# Altium project GTV4.0_Board.PrjPcb (part 6 of 11)

## Sheet Controller_Section.SchDoc
size 420 x 297 mm; DocumentNumber: 7; SheetNumber: 7; SheetTotal: 17
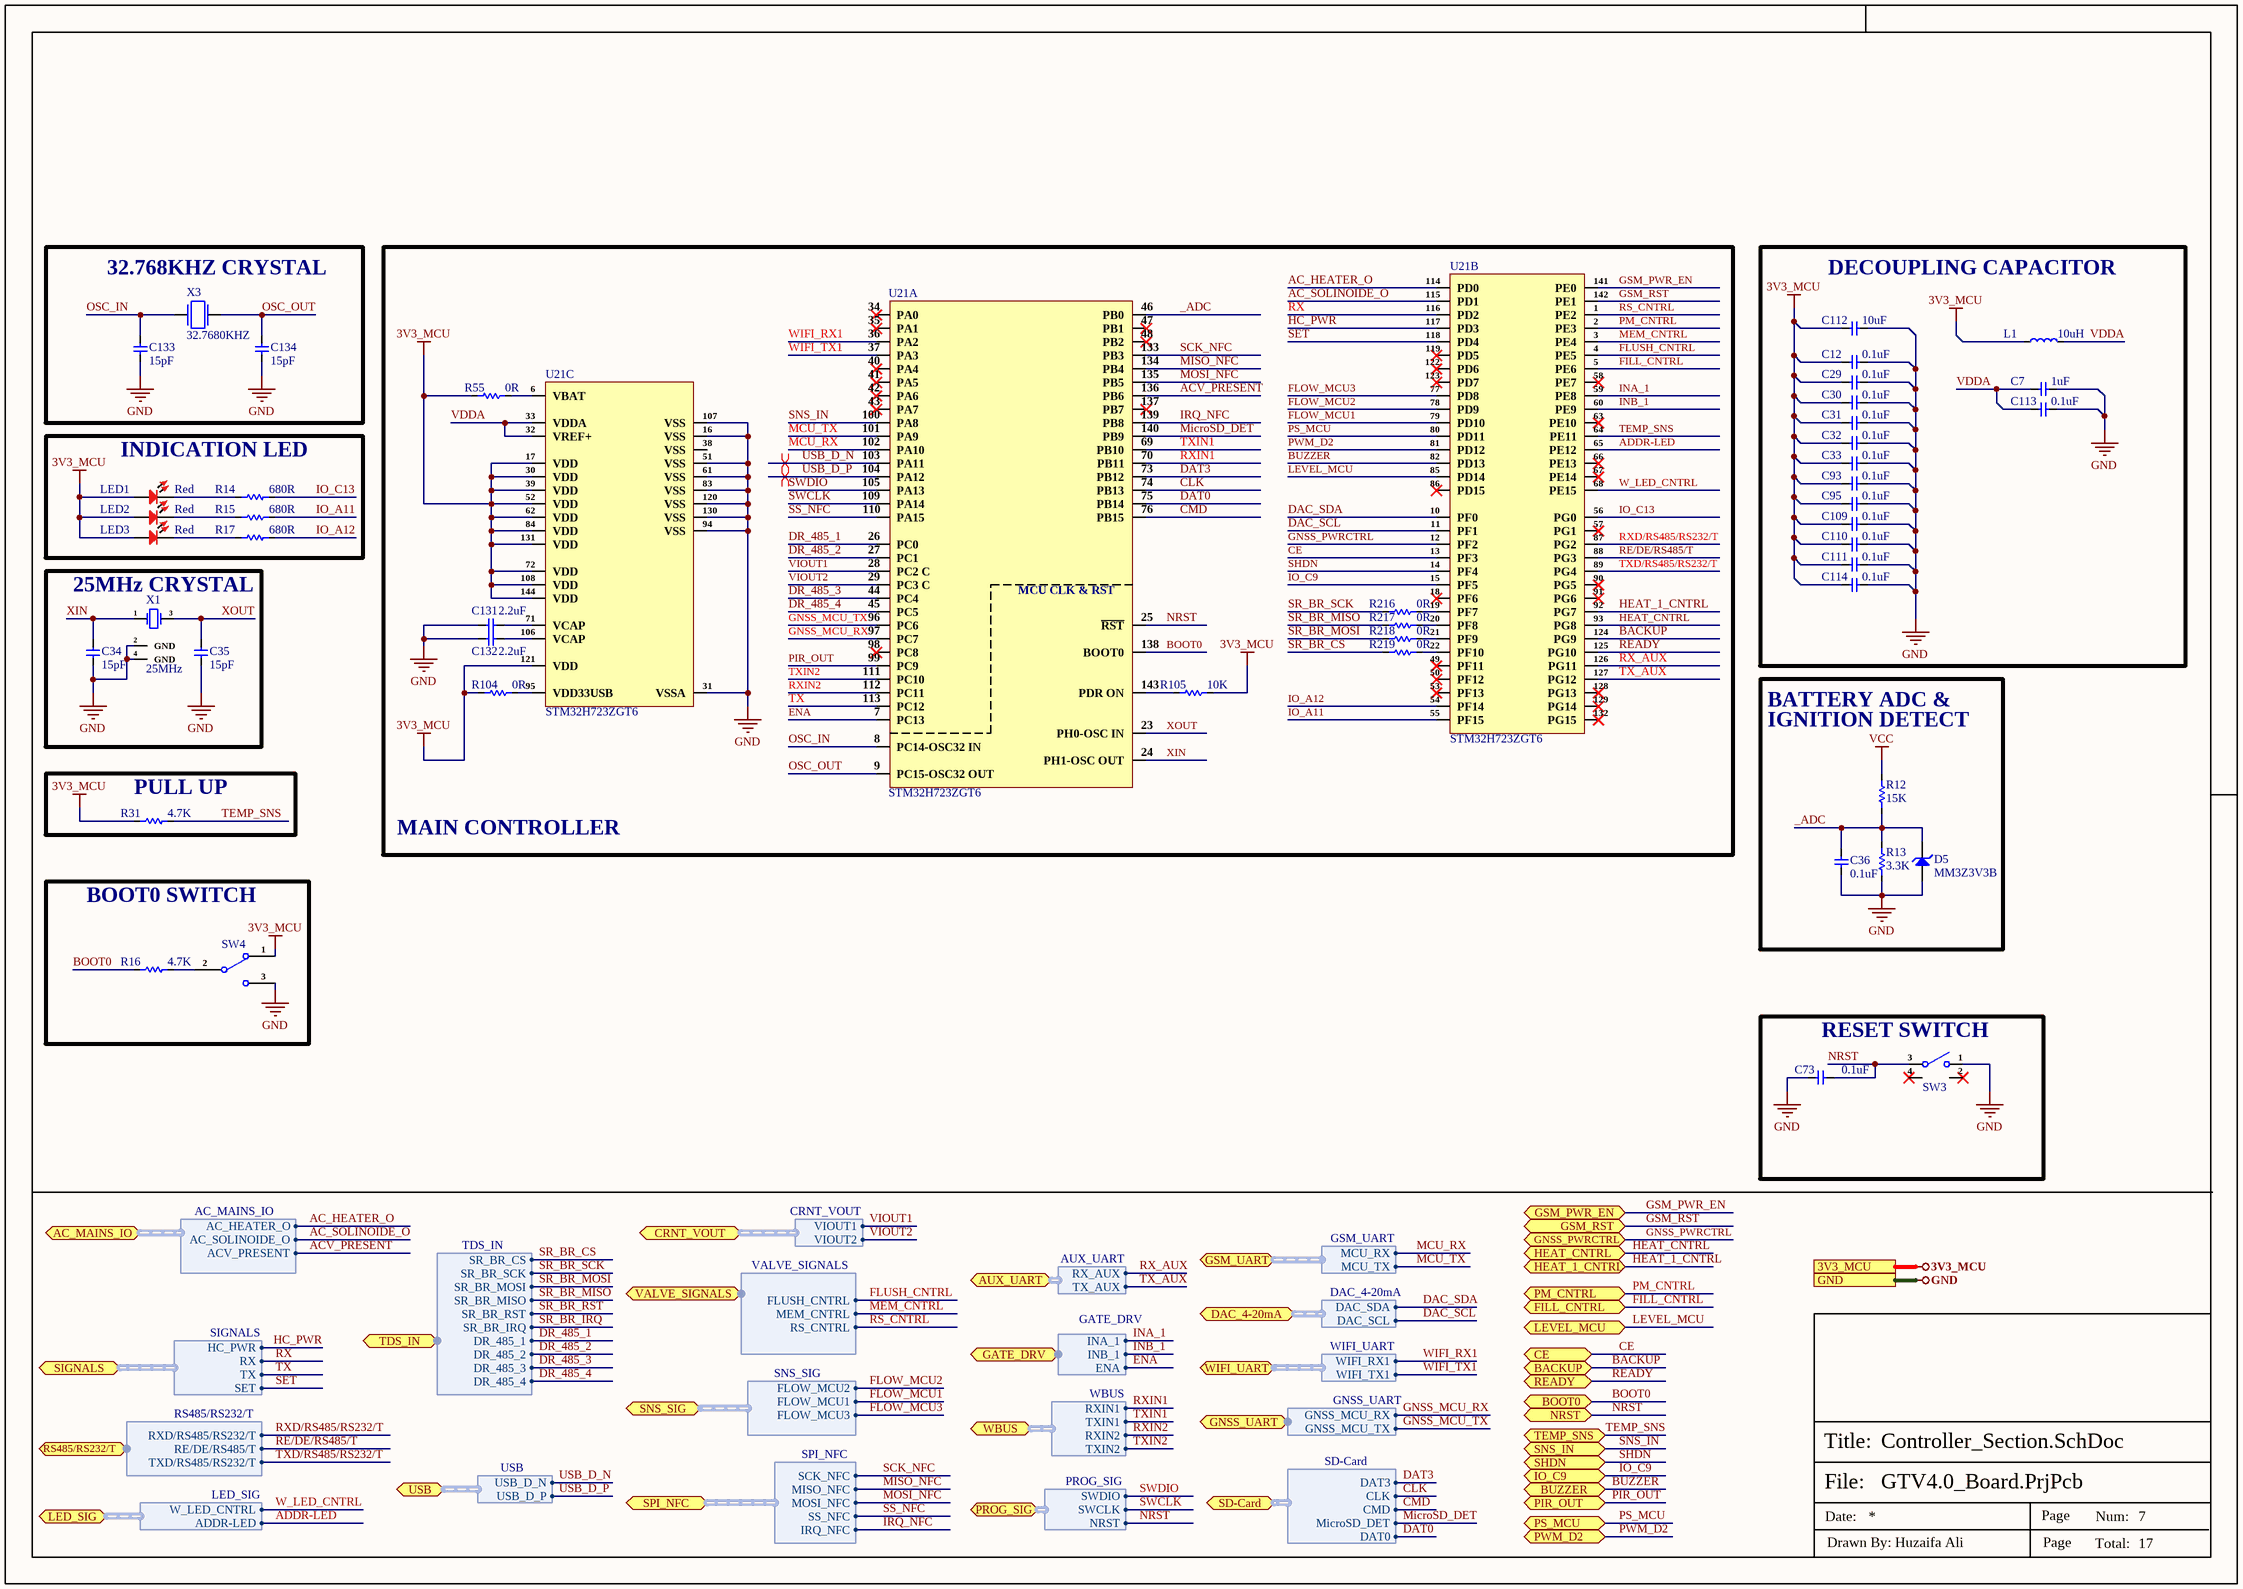
[diagram p9: Controller_Section.SchDoc]

### Parts
C7  1uF  [Cap-0402]
C12  0.1uF  [Cap-0402]
C29  0.1uF  [Cap-0402]
C30  0.1uF  [Cap-0402]
C31  0.1uF  [Cap-0402]
C32  0.1uF  [Cap-0402]
C33  0.1uF  [Cap-0402]
C34  15pF  [Cap-0201]
C35  15pF  [Cap-0201]
C36  0.1uF  [Cap-0402]
C73  0.1uF  [Cap-0402]
C93  0.1uF  [Cap-0402]
C95  0.1uF  [Cap-0402]
C109  0.1uF  [Cap-0402]
C110  0.1uF  [Cap-0402]
C111  0.1uF  [Cap-0402]
C112  10uF  [Cap-0402]
C113  0.1uF  [Cap-0402]
C114  0.1uF  [Cap-0402]
C131  2.2uF  [Cap-0402]
C132  2.2uF  [Cap-0402]
C133  15pF  [Cap-0201]
C134  15pF  [Cap-0201]
D5  MM3Z3V3B  [SOD323F]
L1  10uH  [Ind-0805]
LED1  Red  [LED-0402]
LED2  Red  [LED-0402]
LED3  Red  [LED-0402]
R12  15K  [Res-0603]
R13  3.3K  [Res-0603]
R14  680R  [Res-0603]
R15  680R  [Res-0603]
R16  4.7K  [Res-0402]
R17  680R  [Res-0603]
R31  4.7K  [Res-0402]
R55  0R  [Res-0402]
R104  0R  [Res-0402]
R105  10K  [Res-0402]
R216  0R  [Res-0402]
R217  0R  [Res-0402]
R218  0R  [Res-0402]
R219  0R  [Res-0402]
SW3  FSM6JSMATR  [FSM6JSMATR]  (value not drawn)
SW4  (no value)  [SS-12D02-G040]
U21  STM32H723ZGT6  [LQFP-144(20x20)]  (parts A,B,C of 3)
X1  25MHz  [Q22FA12800090]
X3  32.7680KHZ  [NX3215SA-32.768K-STD-MUA-8_]

### Blocks framed on the sheet
32.768KHZ CRYSTAL: C133 C134 X3
MAIN CONTROLLER: C131 C132 R55 R104 R105 R216-R219 U21
DECOUPLING CAPACITOR: C7 C12 C29-C33 C93 C95 C109-C114 L1
INDICATION LED: LED1-LED3 R14 R15 R17
25MHz CRYSTAL: C34 C35 X1
PULL UP: R31
BOOT0 SWITCH: R16 SW4
RESET SWITCH: C73 SW3

### Ports
3V3_MCU, AC_MAINS_IO (bidir, harness AC_MAINS_IO), AUX_UART (bidir, harness AUX_UART), BACKUP (bidir), BOOT0 (bidir), BUZZER (bidir), CE (bidir), CRNT_VOUT (bidir, harness CRNT_VOUT), DAC_4-20mA (bidir, harness DAC_4-20mA), FILL_CNTRL (bidir), GATE_DRV (bidir, harness GATE_DRV), GND, GNSS_PWRCTRL (bidir), GNSS_UART (bidir, harness GNSS_UART), GSM_PWR_EN (bidir), GSM_RST (bidir), GSM_UART (bidir, harness GSM_UART), HEAT_1_CNTRL (bidir), HEAT_CNTRL (bidir), IO_C9 (bidir), LED_SIG (bidir, harness LED_SIG), LEVEL_MCU (bidir), NRST (bidir), PIR_OUT (bidir), PM_CNTRL (bidir), PROG_SIG (bidir, harness PROG_SIG), PS_MCU (bidir), PWM_D2 (bidir), READY (bidir), RS485/RS232/T (bidir, harness RS485/RS232/T), SD-Card (bidir, harness SD-Card), SHDN (bidir), SIGNALS (bidir, harness SIGNALS), SNS_IN (bidir), SNS_SIG (bidir, harness SNS_SIG), SPI_NFC (bidir, harness SPI_NFC), TDS_IN (bidir, harness TDS_IN), TEMP_SNS (bidir), USB (bidir, harness USB), VALVE_SIGNALS (bidir, harness VALVE_SIGNALS), WBUS (bidir, harness WBUS), WIFI_UART (bidir, harness WIFI_UART)

### Harnesses
SNS_SIG: FLOW_MCU1, FLOW_MCU2, FLOW_MCU3
SPI_NFC: MISO_NFC, MOSI_NFC, SS_NFC, IRQ_NFC, SCK_NFC
TDS_IN: SR_BR_RST, SR_BR_IRQ, DR_485_1, DR_485_2, SR_BR_CS, SR_BR_SCK, SR_BR_MOSI, SR_BR_MISO, DR_485_3, DR_485_4
PROG_SIG: SWDIO, SWCLK, NRST
WBUS: RXIN1, TXIN1, RXIN2, TXIN2
GATE_DRV: INA_1, INB_1, ENA
SD-Card: DAT3, CLK, CMD, DAT0, MicroSD_DET
LED_SIG: ADDR-LED, W_LED_CNTRL
RS485/RS232/T: RXD/RS485/RS232/T, RE/DE/RS485/T, TXD/RS485/RS232/T
SIGNALS: RX, TX, SET, HC_PWR
VALVE_SIGNALS: FLUSH_CNTRL, MEM_CNTRL, RS_CNTRL
AUX_UART: RX_AUX, TX_AUX
GNSS_UART: GNSS_MCU_RX, GNSS_MCU_TX
WIFI_UART: WIFI_RX1, WIFI_TX1
DAC_4-20mA: DAC_SDA, DAC_SCL
GSM_UART: MCU_RX, MCU_TX
CRNT_VOUT: VIOUT1, VIOUT2
AC_MAINS_IO: AC_HEATER_O, AC_SOLINOIDE_O, ACV_PRESENT
USB: USB_D_N, USB_D_P

### Nets
3V3_MCU: C12.1 C29.1 C30.1 C31.1 C32.1 C33.1 C93.1 C95.1 C109.1 C110.1 C111.1 C112.1 C114.1 L1.1 LED1.1 LED2.1 LED3.1 R31.1 R55.1 R104.1 R105.2 SW4.1 U21.17(VDD) U21.30(VDD) U21.39(VDD) U21.52(VDD) U21.62(VDD) U21.72(VDD) U21.84(VDD) U21.108(VDD) U21.121(VDD) U21.131(VDD) U21.144(VDD) ; port 3V3_MCU
GND: C7.2 C12.2 C29.2 C30.2 C31.2 C32.2 C33.2 C34.1 C35.1 C36.1 C73.1 C93.2 C95.2 C109.2 C110.2 C111.2 C112.2 C113.2 C114.2 C131.1 C132.1 C133.1 C134.1 D5.1(A) R13.1 SW3.1 SW4.3 U21.16(VSS) U21.31(VSSA) U21.51(VSS) U21.61(VSS) U21.83(VSS) U21.94(VSS) U21.107(VSS) U21.120(VSS) U21.130(VSS) X1.2(GND) X1.4(GND) ; port GND
VCC: R12.2
_ADC: C36.2 D5.2(K) R12.1 R13.2 U21.46(PB0)
AC_HEATER_O: U21.114(PD0) ; port AC_MAINS_IO.AC_HEATER_O
AC_SOLINOIDE_O: U21.115(PD1) ; port AC_MAINS_IO.AC_SOLINOIDE_O
ACV_PRESENT: U21.136(PB6) ; port AC_MAINS_IO.ACV_PRESENT
ADDR-LED: U21.65(PE12) ; port LED_SIG.ADDR-LED
BACKUP: U21.124(PG9) ; port BACKUP
BOOT0: R16.1 U21.138(BOOT0) ; port BOOT0
BUZZER: U21.82(PD13) ; port BUZZER
CE: U21.13(PF3) ; port CE
CLK: U21.74(PB13) ; port SD-Card.CLK
CMD: U21.76(PB15) ; port SD-Card.CMD
DAC_SCL: U21.11(PF1) ; port DAC_4-20mA.DAC_SCL
DAC_SDA: U21.10(PF0) ; port DAC_4-20mA.DAC_SDA
DAT0: U21.75(PB14) ; port SD-Card.DAT0
DAT3: U21.73(PB12) ; port SD-Card.DAT3
DR_485_1: U21.26(PC0) ; port TDS_IN.DR_485_1
DR_485_2: U21.27(PC1) ; port TDS_IN.DR_485_2
DR_485_3: U21.44(PC4) ; port TDS_IN.DR_485_3
DR_485_4: U21.45(PC5) ; port TDS_IN.DR_485_4
ENA: U21.7(PC13) ; port GATE_DRV.ENA
FILL_CNTRL: U21.5(PE6) ; port FILL_CNTRL
FLOW_MCU1: U21.79(PD10) ; port SNS_SIG.FLOW_MCU1
FLOW_MCU2: U21.78(PD9) ; port SNS_SIG.FLOW_MCU2
FLOW_MCU3: U21.77(PD8) ; port SNS_SIG.FLOW_MCU3
FLUSH_CNTRL: U21.4(PE5) ; port VALVE_SIGNALS.FLUSH_CNTRL
GNSS_MCU_RX: U21.97(PC7) ; port GNSS_UART.GNSS_MCU_RX
GNSS_MCU_TX: U21.96(PC6) ; port GNSS_UART.GNSS_MCU_TX
GNSS_PWRCTRL: U21.12(PF2) ; port GNSS_PWRCTRL
GSM_PWR_EN: U21.141(PE0) ; port GSM_PWR_EN
GSM_RST: U21.142(PE1) ; port GSM_RST
HC_PWR: U21.117(PD3) ; port SIGNALS.HC_PWR
HEAT_1_CNTRL: U21.92(PG7) ; port HEAT_1_CNTRL
HEAT_CNTRL: U21.93(PG8) ; port HEAT_CNTRL
INA_1: U21.59(PE8) ; port GATE_DRV.INA_1
INB_1: U21.60(PE9) ; port GATE_DRV.INB_1
IO_A11: R15.2 U21.55(PF15)
IO_A12: R17.2 U21.54(PF14)
IO_C9: U21.15(PF5) ; port IO_C9
IO_C13: R14.2 U21.56(PG0)
IRQ_NFC: U21.139(PB8) ; port SPI_NFC.IRQ_NFC
LEVEL_MCU: U21.85(PD14) ; port LEVEL_MCU
MCU_RX: U21.102(PA10) ; port GSM_UART.MCU_RX
MCU_TX: U21.101(PA9) ; port GSM_UART.MCU_TX
MEM_CNTRL: U21.3(PE4) ; port VALVE_SIGNALS.MEM_CNTRL
MicroSD_DET: U21.140(PB9) ; port SD-Card.MicroSD_DET
MISO_NFC: U21.134(PB4) ; port SPI_NFC.MISO_NFC
MOSI_NFC: U21.135(PB5) ; port SPI_NFC.MOSI_NFC
NRST: C73.2 SW3.3 U21.25(~{RST}) ; port NRST, port PROG_SIG.NRST
OSC_IN: C133.2 U21.8(PC14-OSC32_IN) X3.2
OSC_OUT: C134.2 U21.9(PC15-OSC32_OUT) X3.1
PIR_OUT: U21.99(PC9) ; port PIR_OUT
PM_CNTRL: U21.2(PE3) ; port PM_CNTRL
PS_MCU: U21.80(PD11) ; port PS_MCU
PWM_D2: U21.81(PD12) ; port PWM_D2
RE/DE/RS485/T: U21.88(PG3) ; port RS485/RS232/T.RE/DE/RS485/T
READY: U21.125(PG10) ; port READY
RS_CNTRL: U21.1(PE2) ; port VALVE_SIGNALS.RS_CNTRL
RX: U21.116(PD2) ; port SIGNALS.RX
RX_AUX: U21.126(PG11) ; port AUX_UART.RX_AUX
RXD/RS485/RS232/T: U21.87(PG2) ; port RS485/RS232/T.RXD/RS485/RS232/T
RXIN1: U21.70(PB11) ; port WBUS.RXIN1
RXIN2: U21.112(PC11) ; port WBUS.RXIN2
SCK_NFC: U21.133(PB3) ; port SPI_NFC.SCK_NFC
SET: U21.118(PD4) ; port SIGNALS.SET
SHDN: U21.14(PF4) ; port SHDN
SNS_IN: U21.100(PA8) ; port SNS_IN
SR_BR_CS: R219.1 ; port TDS_IN.SR_BR_CS
SR_BR_MISO: R217.1 ; port TDS_IN.SR_BR_MISO
SR_BR_MOSI: R218.1 ; port TDS_IN.SR_BR_MOSI
SR_BR_SCK: R216.1 ; port TDS_IN.SR_BR_SCK
SS_NFC: U21.110(PA15) ; port SPI_NFC.SS_NFC
SWCLK: U21.109(PA14) ; port PROG_SIG.SWCLK
SWDIO: U21.105(PA13) ; port PROG_SIG.SWDIO
TEMP_SNS: R31.2 U21.64(PE11) ; port TEMP_SNS
TX: U21.113(PC12) ; port SIGNALS.TX
TX_AUX: U21.127(PG12) ; port AUX_UART.TX_AUX
TXD/RS485/RS232/T: U21.89(PG4) ; port RS485/RS232/T.TXD/RS485/RS232/T
TXIN1: U21.69(PB10) ; port WBUS.TXIN1
TXIN2: U21.111(PC10) ; port WBUS.TXIN2
USB_D_N: U21.103(PA11) ; port USB.USB_D_N
USB_D_P: U21.104(PA12) ; port USB.USB_D_P
VDDA: C7.1 C113.1 L1.2 U21.32(VREF+) U21.33(VDDA)
VIOUT1: U21.28(PC2_C) ; port CRNT_VOUT.VIOUT1  [project net CRNT_VOUT.VIOUT1]
VIOUT2: U21.29(PC3_C) ; port CRNT_VOUT.VIOUT2  [project net CRNT_VOUT.VIOUT2]
W_LED_CNTRL: U21.68(PE15) ; port LED_SIG.W_LED_CNTRL
WIFI_RX1: U21.36(PA2) ; port WIFI_UART.WIFI_RX1
WIFI_TX1: U21.37(PA3) ; port WIFI_UART.WIFI_TX1
XIN: C34.2 U21.24(PH1-OSC_OUT) X1.1(OSC1)
XOUT: C35.2 U21.23(PH0-OSC_IN) X1.3(OSC2)
NetC131_2: C131.2 U21.71(VCAP)
NetC132_2: C132.2 U21.106(VCAP)
NetLED1_2: LED1.2 R14.1
NetLED2_2: LED2.2 R15.1
NetLED3_2: LED3.2 R17.1
NetR16_2: R16.2 SW4.2
NetR55_2: R55.2 U21.6(VBAT)
NetR104_2: R104.2 U21.95(VDD33USB)
NetR105_1: R105.1 U21.143(PDR_ON)
NetR216_2: R216.2 U21.19(PF7)
NetR217_2: R217.2 U21.20(PF8)
NetR218_2: R218.2 U21.21(PF9)
NetR219_2: R219.2 U21.22(PF10)

Not connected (* = marked no-connect by the designer): SW3 2* 4*; U21 18(PF6)* 34(PA0)* 35(PA1)* 38(VSS) 40(PA4)* 41(PA5)* 42(PA6)* 43(PA7)* 47(PB1)* 48(PB2)* 49(PF11)* 50(PF12)* 53(PF13)* 57(PG1)* 58(PE7)* 63(PE10)* 66(PE13)* 67(PE14)* 86(PD15)* 90(PG5)* 91(PG6)* 98(PC8)* 119(PD5)* 122(PD6)* 123(PD7)* 128(PG13)* 129(PG14)* 132(PG15)* 137(PB7)*

### Layout directives
differential pair; differential pair class USB_D_Lines; net class USB_D; rule Matched Net Lengths [Tolerance = 50mil]; rule Impedance Constraint [Min = 85.00    Max = 90.00    ]: USB_D_N, USB_D_P

### Notes on the sheet
- BATTERY ADC &
- (near R12) IGNITION DETECT
- File:
- Title:
- Date:
- Page
- Num:
- Total:
- Drawn By: Huzaifa Ali
- (in symbol STM32H723ZGT6, part A) MCU CLK & RST

### Library data of the parts
C7 = CC0402KRX5R7BB105: CAP CER 1UF 16V X5R 0402; Manufacturer: Yageo; Tolerance: 10%; Item Type: Capacitor; Supplier 1: Digi-Key; Manufacturer Part Number: CC0402KRX5R7BB105; Stock 1: 1405667; Pricing 1: 1=0.36, 10=0.252, 100=0.1512, 500=0.1134, 1000=0.09576, 2500=0.09072, 5000=0.08568 (USD); Mount: Surface Mount; Case/Package: 0402; Case Code (Metric): 1005; Case Code (Imperial): 0402; Weight: 2.3E-05oz; Min Operating Temperature: -55°C; Max Operating Temperature: 85°C; Capacitance: 1uF; Packaging: Tape and Reel; Voltage Rating: 16V; Dielectric: X5R; Termination: SMD/SMT; Voltage Rating (DC): 16V; Length: 1mm; Width: 0.02inch; Height: 0.5mm; Thickness: 0.022inch; ComponentLink1URL: http://www.yageo.com/documents/recent/UPY-GPHC_X5R_4V-to-50V_12.pdf?src-supplier=Avnet+Europe; ComponentLink1Description: http://www.yageo.com/documents/recent/UPY-GPHC_X5R_4V-to-50V_12.pdf?src-supplier=Avnet+Europe; Supplier Part Number 1: 311-1691-6-ND; Composition: Ceramic; Depth: 0.5mm; Radiation Hardening: No; Lead Free: Lead Free; Halogen Free: Halogen Free; LCSC Part Number: C325464
C12 C29-C33 C36 C73 C93 C95 C109-C111 C113 C114 = C1005X5R1H104K050BB: CAP CER 0.1UF 50V X5R 0402; Manufacturer: TDK; Capacitance: 100nF; Tolerance: 10%; Dielectric Material: Ceramic; Item Type: Capacitor; Supplier 1: Digi-Key; Manufacturer Part Number: C1005X5R1H104K050BB; Stock 1: 1455182; Pricing 1: 1=0.12, 10=0.09, 50=0.049, 100=0.04, 500=0.02858, 1000=0.02245, 2500=0.02041, 5000=0.01878 (USD); Mount: Surface Mount; Case/Package: 0402; Case Code (Metric): 1005; Case Code (Imperial): 0402; Weight: 2.3E-05oz; Min Operating Temperature: -55°C; Max Operating Temperature: 85°C; Packaging: Tape and Reel; Voltage Rating: 50V; Dielectric: X5R; Termination: SMD/SMT; Voltage Rating (DC): 50V; Package Quantity: 1; Length: 1mm; Width: 0.02inch; Height: 0.5mm; Thickness: 0.022inch; RoHS Compliant: Yes; ComponentLink1URL: https://product.tdk.com/info/en/catalog/spec/mlccspec_commercial_general_midvoltage_en.pdf?src-supplier=Digi-Key; ComponentLink1Description: https://product.tdk.com/info/en/catalog/spec/mlccspec_commercial_general_midvoltage_en.pdf?src-supplier=Digi-Key; ComponentLink2URL: http://www.tdk.co.jp/tefe02/e413_c.pdf?src-supplier=Future+Electronics; ComponentLink2Description: http://www.tdk.co.jp/tefe02/e413_c.pdf?src-supplier=Future+Electronics; ComponentLink3URL: https://www.verical.com/server-webapp/html/getDatasheet?partID=743571&src-supplier=Verical; ComponentLink3Description: https://www.verical.com/server-webapp/html/getDatasheet?partID=743571&src-supplier=Verical; Supplier Part Number 1: 445-5942-1-ND; Construction: Flat; Resistor Type: Ceramic; Voltage: 50V; Series: C; Depth: 0.5mm; Radiation Hardening: No; Lead Free: Lead Free; REACH SVHC: No SVHC; ComponentLink4URL: http://www.tdk.co.jp/tefe02/e412_c.pdf?src-supplier=Avnet+Europe; ComponentLink4Description: http://www.tdk.co.jp/tefe02/e412_c.pdf?src-supplier=Avnet+Europe; LCSC Part Number: C2181865
C34 C35 C133 C134 = CC0201JRNPO9BN150: CAP CER 15PF 50V C0G/NPO 0201; Manufacturer: Yageo; Item Type: Capacitor; Supplier: Future Electronics; Supplier Part Number: 2580314; Manufacturer Part Number: CC0201JRNPO9BN150; RoHS: Yes; Category: Ceramic Capacitors; Stock: 585000; Pricing: 15000=0.0012, 60000=0.0011, 225000=0.0011, 600000=0.001, 1500000=0.001 (USD); ComponentLink1URL: https://datasheet.ciiva.com/176/mlccorderingcode-176501.pdf?src-supplier=Digi-Key; ComponentLink1Description: https://datasheet.ciiva.com/176/mlccorderingcode-176501.pdf?src-supplier=Digi-Key; ComponentLink2URL: https://datasheet.ciiva.com/176/mlccorderingcode-176502.pdf?src-supplier=Digi-Key; ComponentLink2Description: https://datasheet.ciiva.com/176/mlccorderingcode-176502.pdf?src-supplier=Digi-Key; ComponentLink3URL: https://datasheet.ciiva.com/176/mlccorderingcode-176503.pdf?src-supplier=Digi-Key; ComponentLink3Description: https://datasheet.ciiva.com/176/mlccorderingcode-176503.pdf?src-supplier=Digi-Key; ComponentLink4URL: https://datasheet.ciiva.com/17205/upy-gp-np0-16v-to-50v-8-17205625.pdf?src-supplier=Future+Electronics; ComponentLink4Description: https://datasheet.ciiva.com/17205/upy-gp-np0-16v-to-50v-8-17205625.pdf?src-supplier=Future+Electronics; LCSC Part Number: C277480
C112 = CC0402MRX5R6BB106: CAP CER 10UF 10V X5R 0402; Manufacturer: Yageo; Tolerance: 20%; Item Type: Capacitor; Supplier 1: Future Electronics; Manufacturer Part Number: CC0402MRX5R6BB106; RoHS: Yes; Category: Ceramic Capacitors; Stock 1: 80000; Pricing 1: 10000=0.02650, 20000=0.02590, 30000=0.02550, 40000=0.02530, 50000=0.02450 (USD); Mount: Surface Mount; Case/Package: 0402; Case Code (Imperial): 0402; Case Code (Metric): 1005; Min Operating Temperature: -55°C; Max Operating Temperature: 85°C; Packaging: Tape and Reel; Capacitance: 10uF; Voltage Rating: 10V; RoHS Compliant: Yes; ComponentLink1URL: http://www.yageo.com/documents/recent/UPY-GPHC_X5R_4V-to-50V_25.pdf?src-supplier=Digi-Key; ComponentLink1Description: http://www.yageo.com/documents/recent/UPY-GPHC_X5R_4V-to-50V_25.pdf?src-supplier=Digi-Key; Supplier Part Number 1: 6097631; LCSC Part Number: C962143
C131 C132 = GRM155R61E225KE11D: CAP CER 2.2UF 25V X5R 0402; Manufacturer: Murata; Material: Ceramic; Tolerance: 10%; Item Type: Capacitor; Supplier 1: Avnet; Manufacturer Part Number: GRM155R61E225KE11D; RoHS: Yes; Category: Ceramic Capacitors; Stock 1: 210000; Pricing 1: 10000=0.03830, 20000=0.03623, 40000=0.03416, 60000=0.03209, 80000=0.03002, 100000=0.02795, 1000000=0.02588 (USD); Mount: Surface Mount; Case/Package: 0402; Case Code (Metric): 1005; Case Code (Imperial): 0402; Weight: 0.000212oz; Min Operating Temperature: -55°C; Max Operating Temperature: 85°C; Dielectric: X5R; Capacitance: 2.2uF; Packaging: Tape and Reel; Voltage Rating: 25V; Termination: SMD/SMT; Resistor Type: Ceramic; Voltage Rating (DC): 25V; Package Quantity: 10000; Length: 1mm; Width: 0.5mm; Height: 0.5mm; Thickness: 0.022inch; Lead Free: Lead Free; RoHS Compliant: Yes; ComponentLink1URL: http://www.mouser.com/ds/2/281/c02e-2905.pdf?src-supplier=Mouser; ComponentLink1Description: http://www.mouser.com/ds/2/281/c02e-2905.pdf?src-supplier=Mouser; ComponentLink2URL: http://search.murata.co.jp/Ceramy/image/img/A01X/G101/ENG/GRM155R61E225KE11-01.pdf?src-supplier=Digi-Key; ComponentLink2Description: http://search.murata.co.jp/Ceramy/image/img/A01X/G101/ENG/GRM155R61E225KE11-01.pdf?src-supplier=Digi-Key; ComponentLink3URL: http://search.murata.co.jp/Ceramy/image/img/A01X/partnumbering_e_01.pdf?src-supplier=Digi-Key; ComponentLink3Description: http://search.murata.co.jp/Ceramy/image/img/A01X/partnumbering_e_01.pdf?src-supplier=Digi-Key; ComponentLink4URL: http://psearch.en.murata.com/capacitor/product/GRM155R61E225KE11%23.pdf?src-supplier=Avnet; ComponentLink4Description: http://psearch.en.murata.com/capacitor/product/GRM155R61E225KE11%23.pdf?src-supplier=Avnet; Supplier Part Number 1: GRM155R61E225KE11D; LCSC Part Number: C385032
D5 = MM3Z3V3B: DIODE ZENER 3.3V 200MW SOD323F; Manufacturer: ON Semiconductor / Fairchild; Forward Voltage: 1V; Tolerance: 2%; Impedance: 89R; Max Reverse Leakage Current: 4.5uA; Test Current: 5mA; Element Configuration: Single; Supplier 1: Digi-Key; Manufacturer Part Number: MM3Z3V3B; Stock 1: 473644; Pricing 1: 1=0.22, 10=0.18, 100=0.0956, 500=0.06288, 1000=0.04276 (USD); Mount: Surface Mount; Number of Pins: 2; Weight: 0.0276g; Min Operating Temperature: -65°C; Max Operating Temperature: 150°C; Packaging: Tape and Reel; Package Quantity: 1; Max Power Dissipation: 200mW; Zener Voltage: 3.3V; Voltage Tolerance: 2%; Power Dissipation: 200mW; Working Voltage: 3.3V; Peak Reverse Current: 4.5uA; Length: 1.3mm; Height: 1mm; Width: 1.7mm; Radiation Hardening: No; REACH SVHC: No SVHC; Lead Free: Lead Free; ComponentLink1URL: http://www.onsemi.com/pub/Collateral/MM3Z9V1B-D.pdf?src-supplier=Digi-Key; ComponentLink1Description: http://www.onsemi.com/pub/Collateral/MM3Z9V1B-D.pdf?src-supplier=Digi-Key; ComponentLink2URL: http://www.mouser.com/ds/2/149/MM3Z3V3B-187166.pdf?src-supplier=Mouser; ComponentLink2Description: http://www.mouser.com/ds/2/149/MM3Z3V3B-187166.pdf?src-supplier=Mouser; ComponentLink3URL: https://www.fairchildsemi.com/datasheets/MM/MM3Z9V1B.pdf?src-supplier=Avnet; ComponentLink3Description: https://www.fairchildsemi.com/datasheets/MM/MM3Z9V1B.pdf?src-supplier=Avnet; ComponentLink4URL: http://www.farnell.com/datasheets/1706525.pdf?src-supplier=Element14; ComponentLink4Description: http://www.farnell.com/datasheets/1706525.pdf?src-supplier=Element14; Supplier Part Number 1: MM3Z3V3BCT-ND; LCSC Part Number: C2978865; Item Type: Diode
L1 = MGFL2012F100MT-LF: IND SMD 10uH 500mA 0805; Manufacturer: microgate; Tolerance: ±20%; DC Resistance (DCR): 320mΩ; Item Type: Inductor; Inductance: 10uH; Rated Current: 500mA; Manufacturer Part Number: MGFL2012F100MT-LF; LCSC Part Number: C281113
LED1-LED3 = XZMDK68W-2: LED RED CLEAR CHIP SMD; Manufacturer: SunLED; Lens Color: Colorless; Luminous Intensity: 69mcd; Test Current: 20mA; Viewing Angle: 120°; Dominant Wavelength: 630nm; Forward Voltage: 1.95V; Supplier 1: Digi-Key; Manufacturer Part Number: XZMDK68W-2; Stock 1: 69539; Pricing 1: 1=0.43, 10=0.306, 100=0.136, 500=0.0952, 1000=0.0782 (USD); Mount: Surface Mount; Case/Package: 0402; Color: Red; Case Code (Metric): 1005; Case Code (Imperial): 0402; Packaging: Tape and Reel; Lens Transparency: Clear; Length: 1mm; Height: 0.6mm; Width: 0.5mm; ComponentLink1URL: http://www.sunledusa.com/products/spec/XZMDK68W-2.pdf?src-supplier=Digi-Key; ComponentLink1Description: http://www.sunledusa.com/products/spec/XZMDK68W-2.pdf?src-supplier=Digi-Key; ComponentLink2URL: https://www.sunledusa.com/products/spec/XZMDK68W-2.pdf?src-supplier=Digi-Key; ComponentLink2Description: https://www.sunledusa.com/products/spec/XZMDK68W-2.pdf?src-supplier=Digi-Key; Supplier Part Number 1: 1497-1174-6-ND; Item Type: LED
R12 = RC0603FR-0715KL: RES 15K OHM 1% 1/10W 0603; Manufacturer: Yageo; Temperature Coefficient: 100ppm/°C; Value: 15kR; Power Rating: 100mW; Voltage Rating (DC): 50V; Item Type: Resistor; Supplier 1: Future Electronics; Manufacturer Part Number: RC0603FR-0715KL; RoHS: Yes; Category: Chip SMD Resistors; Stock 1: 13310000; Pricing 1: 5000=0.00150, 50000=0.00140, 100000=0.00140, 200000=0.00140, 375000=0.00140, 625000=0.00130, 1000000=0.00130, 2000000=0.00120, 3750000=0.00120 (USD); Case/Package: 0603; Pins: 2; Case Code (Metric): 1608; Case Code (Imperial): 0603; Min Operating Temperature: -55°C; Max Operating Temperature: 155°C; Tolerance: 1%; Packaging: Tape and Reel; Resistor Type: Thick Film; Series: RC; Package Quantity: 1; Voltage Rating: 50V; Number of Terminations: 2; Termination: SMD/SMT; Max Power Dissipation: 100mW; Features: Moisture Resistant; Resistance Tolerance: 1%; Construction: Rectangular; Length: 0.063inch; Width: 0.031inch; Height: 0.022inch; Depth: 0.8mm; Lead Free: Lead Free; RoHS Compliant: Yes; Military Standard: Not; Supplier Part Number 1: 4083945; LCSC Part Number: C114661
R13 = RC0603DR-073K3L: RES 3.3K OHM 0.5% 1/10W 0603; Manufacturer: Yageo; Resistance: 3.3kR; Max Power Dissipation: 100mW; Temperature Coefficient: 100ppm/°C; Item Type: Resistor; Supplier 1: Avnet; Manufacturer Part Number: RC0603DR-073K3L; RoHS: Yes; Category: Chip SMD Resistors; Pricing 1: 5000=0.00430, 10000=0.00424, 20000=0.00411 (USD); Case/Package: 0603; Min Operating Temperature: -55°C; Max Operating Temperature: 155°C; Packaging: Tape and Reel; Resistor Type: Thick Film; Number of Terminations: 2; Tolerance: 0.5%; Features: Moisture Resistant; Length: 0.063inch; Width: 0.031inch; Height: 0.022inch; RoHS Compliant: Yes; ComponentLink1URL: http://www.yageo.com.tw/exep/pages/download/literatures/PYu-R_INT-thick_7.pdf?src-supplier=Digi-Key; ComponentLink1Description: http://www.yageo.com.tw/exep/pages/download/literatures/PYu-R_INT-thick_7.pdf?src-supplier=Digi-Key; Supplier Part Number 1: RC0603DR-073K3L; LCSC Part Number: C723574
R14 R15 R17 = RC0603FR-07680RL: RES SMD 680 OHM 1% 1/10W 0603; Manufacturer: Yageo; Item Type: Resistor; Manufacturer Part Number: RC0603FR-07680RL; Package: 0603; ComponentLink4URL: https://www.lcsc.com/product-detail/Chip-Resistor-Surface-Mount_YAGEO-RC0603FR-07680RL_C112310.html; ComponentLink4Description: LCSC; LCSC Part Number: C112310
R16 = RC0402FR-074K7L: RES 4.7K OHM 1% 1/16W 0402; Manufacturer: Yageo; Voltage Rating (DC): 50V; Power Rating: 62.5mW; Resistance: 4.7kR; Temperature Coefficient: 100ppm/°C; Max Power Dissipation: 63mW; Item Type: Resistor; Supplier 1: Avnet; Manufacturer Part Number: RC0402FR-074K7L; RoHS: Yes; Category: Chip SMD Resistors; Stock 1: 2420000; Pricing 1: 10000=0.00085 (USD); Case/Package: 0402; Number of Pins: 2; Case Code (Imperial): 0402; Case Code (Metric): 1005; Size Code: 0402; Min Operating Temperature: -55°C; Max Operating Temperature: 155°C; Tolerance: 1%; Voltage Rating: 50V; Packaging: Tape and Reel; Resistor Type: Thick Film; Termination: SMD/SMT; Features: Moisture Resistant; Series: RC; Number of Terminations: 2; Resistance Tolerance: 1%; Construction: Rectangular; Length: 1mm; Width: 0.5mm; Height: 0.32mm; Depth: 0.5mm; Height - Seated (Max): 0.016inch; RoHS Compliant: Yes; Reach SVHC Compliant: Yes; Military Standard: Not; Lead Free: Lead Free; ComponentLink1URL: https://datasheet.ciiva.com/22661/1686128-22661342.pdf?src-supplier=Element14; ComponentLink1Description: https://datasheet.ciiva.com/22661/1686128-22661342.pdf?src-supplier=Element14; ComponentLink2URL: https://datasheet.ciiva.com/7850/1018594-7850022.pdf?src-supplier=Element14; ComponentLink2Description: https://datasheet.ciiva.com/7850/1018594-7850022.pdf?src-supplier=Element14; ComponentLink3URL: https://datasheet.ciiva.com/7850/1018594-7850023.pdf?src-supplier=Element14; ComponentLink3Description: https://datasheet.ciiva.com/7850/1018594-7850023.pdf?src-supplier=Element14; ComponentLink4URL: https://datasheet.ciiva.com/15215/getdatasheetpartid-328119-15215035.pdf?src-supplier=Verical; ComponentLink4Description: https://datasheet.ciiva.com/15215/getdatasheetpartid-328119-15215035.pdf?src-supplier=Verical; Supplier Part Number 1: RC0402FR-074K7L; LCSC Part Number: C105871
R31 = RC0402FR-074K7L: RES 4.7K OHM 1% 1/16W 0402; Manufacturer: Yageo; Item Type: Resistor; Voltage Rating (DC): 50V; Power Rating: 62.5mW; Resistance: 4.7kR; Temperature Coefficient: 100ppm/°C; Max Power Dissipation: 63mW; Manufacturer Part Number: RC0402FR-074K7L; ComponentLink1URL: https://datasheet.ciiva.com/22661/1686128-22661342.pdf?src-supplier=Element14; ComponentLink1Description: https://datasheet.ciiva.com/22661/1686128-22661342.pdf?src-supplier=Element14; RoHS: Yes; Category: Chip SMD Resistors; ComponentLink2URL: https://datasheet.ciiva.com/7850/1018594-7850022.pdf?src-supplier=Element14; ComponentLink2Description: https://datasheet.ciiva.com/7850/1018594-7850022.pdf?src-supplier=Element14; ComponentLink3URL: https://datasheet.ciiva.com/7850/1018594-7850023.pdf?src-supplier=Element14; ComponentLink3Description: https://datasheet.ciiva.com/7850/1018594-7850023.pdf?src-supplier=Element14; ComponentLink4URL: https://datasheet.ciiva.com/15215/getdatasheetpartid-328119-15215035.pdf?src-supplier=Verical; ComponentLink4Description: https://datasheet.ciiva.com/15215/getdatasheetpartid-328119-15215035.pdf?src-supplier=Verical; LCSC Part Number: C105871; Supplier 1: Avnet; Stock 1: 2420000; Pricing 1: 10000=0.00085 (USD); Case/Package: 0402; Number of Pins: 2; Case Code (Imperial): 0402; Case Code (Metric): 1005; Size Code: 0402; Min Operating Temperature: -55°C; Max Operating Temperature: 155°C; Tolerance: 1%; Voltage Rating: 50V; Packaging: Tape and Reel; Resistor Type: Thick Film; Termination: SMD/SMT; Features: Moisture Resistant; Series: RC; Number of Terminations: 2; Resistance Tolerance: 1%; Construction: Rectangular; Length: 1mm; Width: 0.5mm; Height: 0.32mm; Depth: 0.5mm; Height - Seated (Max): 0.016inch; RoHS Compliant: Yes; Reach SVHC Compliant: Yes; Military Standard: Not; Lead Free: Lead Free; Supplier Part Number 1: RC0402FR-074K7L
R55 R104 R216-R219 = RC0402FR-070RL: RES 0 OHM JUMPER 1/16W 0402; Manufacturer: Yageo; Item Type: Resistors; Tolerance: 1%; Power Rating: 62.5mW; Voltage Rating: 50V; Temperature Coefficient: 200ppm/°C; Max Power Dissipation: 63mW; Supplier 1: Mouser; Manufacturer Part Number: RC0402FR-070RL; RoHS: Yes; Stock 1: 8556842; Pricing 1: 1=0.10000, 10=0.01400, 50=0.01400, 100=0.00600, 1000=0.00300, 5000=0.00200, 10000=0.00100 (USD); Mount: Surface Mount; Case/Package: 0402; Contact Plating: Tin,Matte; Case Code (Imperial): 0402; Case Code (Metric): 1005; Size Code: 0402; Min Operating Temperature: -55°C; Max Operating Temperature: 155°C; Resistance: 0R; Resistor Type: Thick Film; Packaging: Tape and Reel; Termination: SMD/SMT; Features: Moisture Resistant; Series: RC; Number of Terminations: 2; Length: 1mm; Width: 0.5mm; Height: 0.35mm; Radiation Hardening: No; Lead Free: Lead Free; RoHS Compliant: Yes; ComponentLink1URL: https://datasheet.ciiva.com/8896/pyu-rc0402-51-rohs-l-6-8896149.pdf?src-supplier=Avnet; ComponentLink1Description: https://datasheet.ciiva.com/8896/pyu-rc0402-51-rohs-l-6-8896149.pdf?src-supplier=Avnet; ComponentLink2URL: https://datasheet.ciiva.com/16790/pyu-rc0402-51-rohs-l-6-r-16790444.pdf?src-supplier=Future+Electronics; ComponentLink2Description: https://datasheet.ciiva.com/16790/pyu-rc0402-51-rohs-l-6-r-16790444.pdf?src-supplier=Future+Electronics; Supplier Part Number 1: 603-RC0402FR-070RL; LCSC Part Number: C106231
R105 = RC0402FR-0710KL: RES 10K OHM 1% 1/16W 0402; Manufacturer: Yageo; Resistance: 10kR; Voltage Rating (DC): 50V; Temperature Coefficient: 100ppm/°C; Power Rating: 62.5mW; Max Power Dissipation: 63mW; Item Type: Resistor; Supplier 1: Mouser; Manufacturer Part Number: RC0402FR-0710KL; RoHS: Yes; Category: Chip SMD Resistors; Stock 1: 18648329; Pricing 1: 1=0.10000, 10=0.01400, 50=0.01400, 100=0.00500, 1000=0.00300, 10000=0.00200 (USD); Case/Package: 0402; Number of Pins: 2; Case Code (Imperial): 0402; Case Code (Metric): 1005; Min Operating Temperature: -55°C; Max Operating Temperature: 155°C; Resistor Type: Thick Film; Tolerance: 1%; Packaging: Tape and Reel; Voltage Rating: 50V; Termination: SMD/SMT; Working Voltage: 50V; Number of Terminations: 2; Features: Moisture Resistant; Series: RC; Resistance Tolerance: 1%; Construction: Rectangular; Length: 1mm; Width: 0.5mm; Height: 0.32mm; Depth: 0.5mm; Lead Pitch: 0.2mm; REACH SVHC: No SVHC; Lead Free: Lead Free; RoHS Compliant: Yes; Military Standard: Not; ComponentLink1URL: https://datasheet.ciiva.com/7660/38568-7660787.pdf?src-supplier=Element14; ComponentLink1Description: https://datasheet.ciiva.com/7660/38568-7660787.pdf?src-supplier=Element14; ComponentLink2URL: https://datasheet.ciiva.com/7849/1686128-7849814.pdf?src-supplier=Element14; ComponentLink2Description: https://datasheet.ciiva.com/7849/1686128-7849814.pdf?src-supplier=Element14; ComponentLink3URL: https://datasheet.ciiva.com/7983/1018594-7983486.pdf?src-supplier=Element14; ComponentLink3Description: https://datasheet.ciiva.com/7983/1018594-7983486.pdf?src-supplier=Element14; ComponentLink4URL: https://datasheet.ciiva.com/22747/1018594-22747512.pdf?src-supplier=Element14; ComponentLink4Description: https://datasheet.ciiva.com/22747/1018594-22747512.pdf?src-supplier=Element14; ComponentLink5URL: https://datasheet.ciiva.com/12667/pyu-rc0402-51-rohs-l-6-r-12667067.pdf?src-supplier=Mouser; ComponentLink5Description: https://datasheet.ciiva.com/12667/pyu-rc0402-51-rohs-l-6-r-12667067.pdf?src-supplier=Mouser; ComponentLink6URL: https://datasheet.ciiva.com/7849/1784430-7849813.pdf?src-supplier=Element14; ComponentLink6Description: https://datasheet.ciiva.com/7849/1784430-7849813.pdf?src-supplier=Element14; ComponentLink7URL: https://datasheet.ciiva.com/7849/1784430-7849815.pdf?src-supplier=Element14; ComponentLink7Description: https://datasheet.ciiva.com/7849/1784430-7849815.pdf?src-supplier=Element14; Supplier Part Number 1: 603-RC0402FR-0710KL; LCSC Part Number: C60490
SW3 = FSM6JSMATR: SWITCH TACTILE SPST-NO 0.05A 24V; Manufacturer: TE Connectivity Alcoswitch; Item Type: Switches; Number of Positions: 2NUMBER; Supplier: Rs; LCSC Part Number: C6558197; Manufacturer Part Number: FSM6JSMATR; RoHS: Yes; Stock: 735; RoHS Compliant: 5897YesNo; ComponentLink1URL: https://datasheet.ciiva.com/7097/1486952-7097325.pdf?src-supplier=Newark; ComponentLink1Description: https://datasheet.ciiva.com/7097/1486952-7097325.pdf?src-supplier=Newark; ComponentLink2URL: https://datasheet.ciiva.com/1530/1714712-1530976.pdf?src-supplier=Element14; ComponentLink2Description: https://datasheet.ciiva.com/1530/1714712-1530976.pdf?src-supplier=Element14; ComponentLink3URL: https://datasheet.ciiva.com/15184/getdatasheetpartid-167889-15184443.pdf?src-supplier=Verical; ComponentLink3Description: https://datasheet.ciiva.com/15184/getdatasheetpartid-167889-15184443.pdf?src-supplier=Verical; ComponentLink4URL: https://datasheet.ciiva.com/8082/eng-cs-1308111-1-switches-core-program-catalog-0308-8082682.pdf?src-supplier=Avnet; ComponentLink4Description: https://datasheet.ciiva.com/8082/eng-cs-1308111-1-switches-core-program-catalog-0308-8082682.pdf?src-supplier=Avnet
SW4 = SS-12D02-G040: Straight 1A SPDT 8.7mm 8.6mm 24V 4.5mm Black PCPin 10000 Rectangular columnar -25℃~+70℃ Plugin Slide Switches ROHS; Manufacturer: G-Switch; Item Type: Switch; Manufacturer Part Number: SS-12D02-G040; Package: Custom; LCSC Part Number: C2876023; ComponentLink1Description: LCSC; ComponentLink1URL: https://www.lcsc.com/product-detail/Slide-Switches_G-Switch-SS-12D02-G040_C2876023.html
U21 = STM32H723ZGT6: IC MCU 32BIT 1MB FLASH 144LQFP; Manufacturer: STMicroelectronics; Interface: 39,40,224,1514,1515,1518,1532,1533Interface; Memory Format: 4498,11064MemoryType; Data Bus Width: 32b; Frequency: 550MHz; Max Supply Voltage: 3.6V; Min Supply Voltage: 1.62V; Nominal Supply Current: 4uA; Number of A/D Converters: 1NUMBER; Number of ADC Channels: 16NUMBER; Number of I2C Channels: 5NUMBER; Number of I/Os: 112NUMBER; Number of SPI Channels: 6NUMBER; Number of Timers/Counters: 4NUMBER; RAM Size: 564KB; Supplier: Future Electronics; LCSC Part Number: C730146; Manufacturer Part Number: STM32H723ZGT6; RoHS: No; Item Type: IC; Stock: 4380; Pricing: 60=7.31, 120=7.27, 180=7.25, 240=7.23, 300=7.18 (USD); Min Operating Temperature: -40°C; Max Operating Temperature: 85°C; Density: 1MB; Memory Size: 1MB; Number of Ethernet Channels: 1NUMBER; Number of UART Channels: 6NUMBER; Number of USB Channels: 1NUMBER; Height: 1.6mm
X1 = Q22FA12800090: CRYSTAL 25.0000MHZ 12PF SMD; Manufacturer: Seiko Epson; ComponentLink1Description: LCSC; ComponentLink1URL: https://www.lcsc.com/product-detail/Crystals_Seiko-Epson-Q22FA12800090_C255883.html; Manufacturer Part Number: Q22FA12800090; Package: SMD2016-4P; LCSC Part Number: C255883; Item Type: Crystal
X3 = NX3215SA-32.768K-STD-MUA-8: CRYSTAL 32.7680KHZ 12.5PF SMD; Manufacturer: NDK; Frequency: 32.768kHz; Frequency Tolerance: 20ppm; ESR (Equivalent Series Resistance): 70kR; Supplier 1: Digi-Key; Manufacturer Part Number: NX3215SA-32.768K-STD-MUA-8; Stock 1: 29951; Pricing 1: 1=0.68, 10=0.602, 50=0.5628, 100=0.4974, 500=0.47124, 1000=0.3927 (USD); Mount: Surface Mount; Case/Package: SMD/SMT; Number of Pins: 2; Min Operating Temperature: -40°C; Max Operating Temperature: 85°C; Package Quantity: 1000; Load Capacitance: 12.5pF; Packaging: Tape and Reel; Length: 0.126inch; Height: 0.035inch; Width: 0.059inch; Lead Free: Lead Free; ComponentLink1URL: https://media.digikey.com/pdf/Data%20Sheets/NDK%20PDFs/NX3215SA-32.768K-STD-MUA-8.pdf?src-supplier=Digi-Key; ComponentLink1Description: https://media.digikey.com/pdf/Data%20Sheets/NDK%20PDFs/NX3215SA-32.768K-STD-MUA-8.pdf?src-supplier=Digi-Key; ComponentLink2URL: http://www.ndk.com/images/products/catalog/c_NX3215SA-STD-MUA-14_e.pdf?src-supplier=Digi-Key; ComponentLink2Description: http://www.ndk.com/images/products/catalog/c_NX3215SA-STD-MUA-14_e.pdf?src-supplier=Digi-Key; Supplier Part Number 1: 644-1156-6-ND; LCSC Part Number: C156245

## Sheet SD-Card-Sheet.SchDoc
size 420 x 297 mm
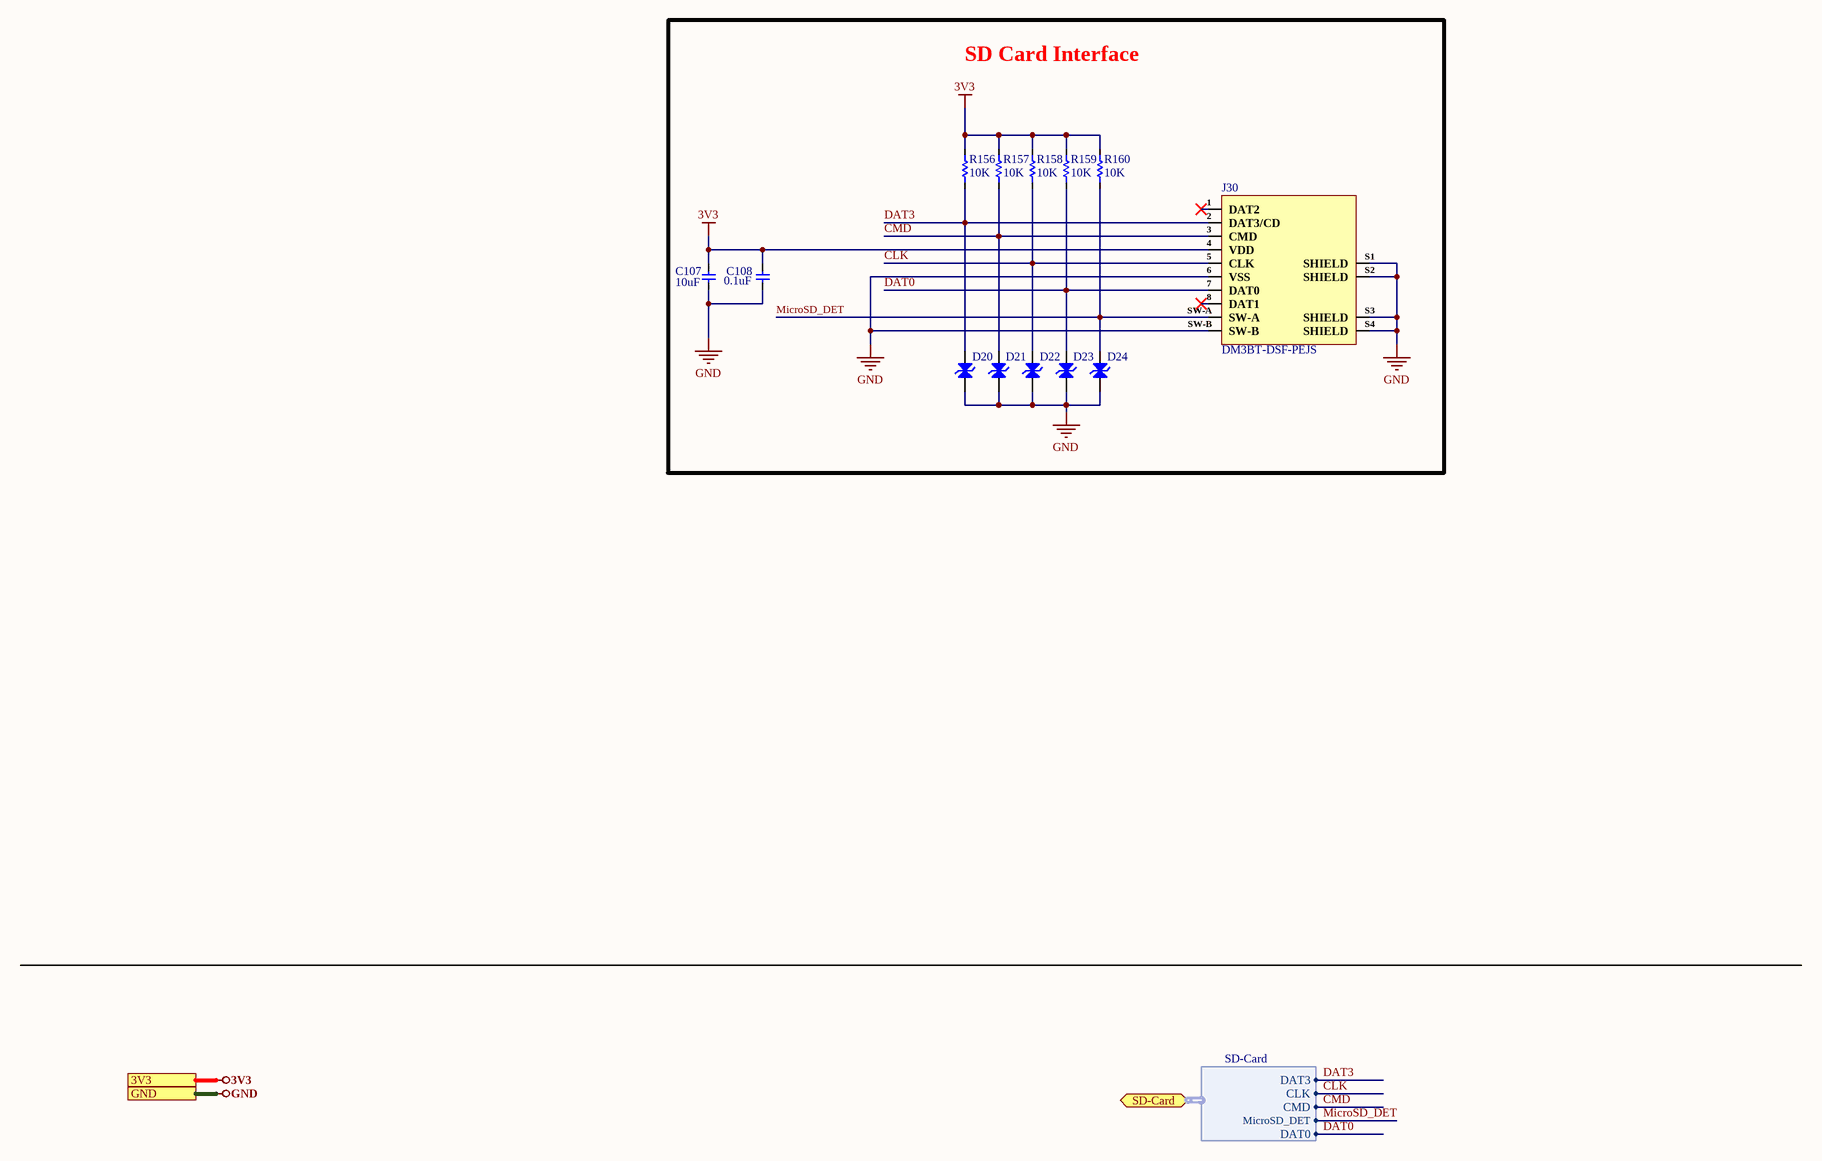
[diagram p10: SD-Card-Sheet.SchDoc]

### Parts
C107  10uF  [Cap-0402]
C108  0.1uF  [CAP-0201]
D20  LESD8D3.3CAT5G  [SOD-882 Bi Directional]  (value not drawn)
D21  LESD8D3.3CAT5G  [SOD-882 Bi Directional]  (value not drawn)
D22  LESD8D3.3CAT5G  [SOD-882 Bi Directional]  (value not drawn)
D23  LESD8D3.3CAT5G  [SOD-882 Bi Directional]  (value not drawn)
D24  LESD8D3.3CAT5G  [SOD-882 Bi Directional]  (value not drawn)
J30  DM3BT-DSF-PEJS  [DM3BT-DSF-PEJS]
R156  10K  [Res-0201]
R157  10K  [Res-0201]
R158  10K  [Res-0201]
R159  10K  [Res-0201]
R160  10K  [Res-0201]

### Blocks framed on the sheet
SD Card Interface: C107 C108 D20-D24 J30 R156-R160

### Ports
3V3, GND, SD-Card (bidir, harness SD-Card)

### Harnesses
SD-Card: DAT3, CLK, CMD, DAT0, MicroSD_DET

### Nets
3V3: C107.2 C108.2 J30.4(VDD) R156.2 R157.2 R158.2 R159.2 R160.2 ; port 3V3
GND: C107.1 C108.1 D20.1(A) D21.1(A) D22.1(A) D23.1(A) D24.1(A) J30.6(VSS) J30.S1(SHIELD) J30.S2(SHIELD) J30.S3(SHIELD) J30.S4(SHIELD) J30.SW-B ; port GND
CLK: D22.2(A) J30.5(CLK) R158.1 ; port SD-Card.CLK
CMD: D21.2(A) J30.3(CMD) R157.1 ; port SD-Card.CMD
DAT0: D23.2(A) J30.7(DAT0) R159.1 ; port SD-Card.DAT0
DAT3: D20.2(A) J30.2(DAT3/CD) R156.1 ; port SD-Card.DAT3
MicroSD_DET: D24.2(A) J30.SW-A R160.1 ; port SD-Card.MicroSD_DET

Not connected (* = marked no-connect by the designer): J30 1(DAT2)* 8(DAT1)*

### Notes on the sheet
- File:
- Title:
- Date:
- Page
- Num:
- Total:
- Drawn By: Huzaifa Ali

### Library data of the parts
C107 = CC0402MRX5R6BB106: as C112 on sheet Controller_Section; Supplier 1: Future Electronics; Manufacturer Part Number: CC0402MRX5R6BB106; RoHS: Yes; Category: Ceramic Capacitors; Stock 1: 80000; Pricing 1: 10000=0.02650, 20000=0.02590, 30000=0.02550, 40000=0.02530, 50000=0.02450 (USD); Mount: Surface Mount; Case/Package: 0402; Case Code (Imperial): 0402; Case Code (Metric): 1005; Min Operating Temperature: -55°C; Max Operating Temperature: 85°C; Packaging: Tape and Reel; Capacitance: 10uF; Voltage Rating: 10V; RoHS Compliant: Yes; ComponentLink1URL: http://www.yageo.com/documents/recent/UPY-GPHC_X5R_4V-to-50V_25.pdf?src-supplier=Digi-Key; ComponentLink1Description: http://www.yageo.com/documents/recent/UPY-GPHC_X5R_4V-to-50V_25.pdf?src-supplier=Digi-Key; Supplier Part Number 1: 6097631; LCSC Part Number: C962143
C108 = GRM033C81E104KE14D: CAP CER 0.1UF 25V X6S 0201; Manufacturer: Murata; Capacitance: 100nF; Tolerance: 10%; Supplier 1: Digi-Key; Manufacturer Part Number: GRM033C81E104KE14D; RoHS: Yes; Category: Ceramic Capacitors; Stock 1: 91; Pricing 1: 1=0.10000, 10=0.05100, 50=0.02780, 100=0.02260, 500=0.01616, 1000=0.01270, 2500=0.01155, 5000=0.01063 (USD); Mount: Surface Mount; Case/Package: 0201; Case Code (Metric): 0603; Case Code (Imperial): 0201; Min Operating Temperature: -55°C; Max Operating Temperature: 105°C; Dielectric: X6S; Packaging: Tape and Reel; Voltage Rating: 25V; Package Quantity: 15000; Voltage Rating (DC): 25V; Termination: SMD/SMT; Length: 0.024inch; Width: 0.3mm; Height: 0.3mm; Thickness: 0.013inch; RoHS Compliant: Yes; ComponentLink1URL: http://www.mouser.com/ds/2/281/c02e-2905.pdf?src-supplier=Mouser; ComponentLink1Description: http://www.mouser.com/ds/2/281/c02e-2905.pdf?src-supplier=Mouser; ComponentLink2URL: http://www.farnell.com/datasheets/2722733.pdf?src-supplier=Farnell; ComponentLink2Description: http://www.farnell.com/datasheets/2722733.pdf?src-supplier=Farnell; ComponentLink3URL: http://search.murata.co.jp/Ceramy/image/img/A01X/G101/ENG/GRM033C81E104KE14-01.pdf?src-supplier=Digi-Key; ComponentLink3Description: http://search.murata.co.jp/Ceramy/image/img/A01X/G101/ENG/GRM033C81E104KE14-01.pdf?src-supplier=Digi-Key; Supplier Part Number 1: 490-10403-1-ND; Weight: 1.2E-05oz
D20-D24 = LESD8D3.3CAT5G: 5V 10V 3.3V Bi-Directional SOD-882 ESD Protection Devices ROHS; Manufacturer: LRC; Manufacturer Part Number: LESD8D3.3CAT5G; Package: SOD-882; LCSC Part Number: C172409; Item Type: Protection Device; ComponentLink1Description: LCSC; ComponentLink1URL: https://www.lcsc.com/product-detail/span-style-background-color-ff0-ESD-span-Protection-Devices_LRC-LESD8D3-3CAT5G_C172409.html
J30 = DM3BT-DSF-PEJS: CONN MICRO SD CARD PUSH-PUSH R/A; Manufacturer: Hirose; Max Current Rating: 500mA; Contact Resistance: 100mR; Voltage Rating (AC): 125V; Gender: Female; Number of Contacts: 8; Connector Type: Connector,Socket; Insulation Resistance: 1GR; Pitch: 1.1mm; Item Type: SD Card Connector; Supplier 1: Future Electronics; Manufacturer Part Number: DM3BT-DSF-PEJS; RoHS: Yes; Category: Memory Connectors; Stock 1: 9600; Pricing 1: 1200=1.39000 (USD); Mount: Surface Mount,Reverse; Contact Material: Copper Alloy,Copper; Contact Plating: Gold; Housing Material: Polymer; Min Operating Temperature: -25°C; Max Operating Temperature: 85°C; Number of Rows: 1; Packaging: Tape and Reel; Current Rating: 500mA; Package Quantity: 1; Termination: Solder; Max Voltage Rating (AC): 125V; Number of Positions: 8; Orientation: Right Angle; Series: DM3; Length: 13.85mm; Width: 16.05mm; Depth: 1.83mm; Radiation Hardening: No; Reach SVHC Compliant: Yes; Lead Free: Lead Free; Flammability Rating: UL94 V-0; RoHS Compliant: Yes; ComponentLink1URL: https://datasheet.ciiva.com/683/doc-1806131255093-683387.pdf?src-supplier=Digi-Key; ComponentLink1Description: https://datasheet.ciiva.com/683/doc-1806131255093-683387.pdf?src-supplier=Digi-Key; Supplier Part Number 1: 3000978; LCSC Part Number: C597972
R156-R160 = RC0201FR-0710KL: RES SMD 10K OHM 1% 1/20W 0201; Manufacturer: Yageo; Item Type: Resistor; Manufacturer Part Number: RC0201FR-0710KL; ComponentLink7URL: https://www.lcsc.com/product-detail/Chip-Resistor-Surface-Mount_YAGEO-RC0201FR-0710KL_C106225.html; ComponentLink7Description: LCSC; LCSC Part Number: C106225; Package: 0201

## Sheet WIFI_Display_Sheet.SchDoc
size A4
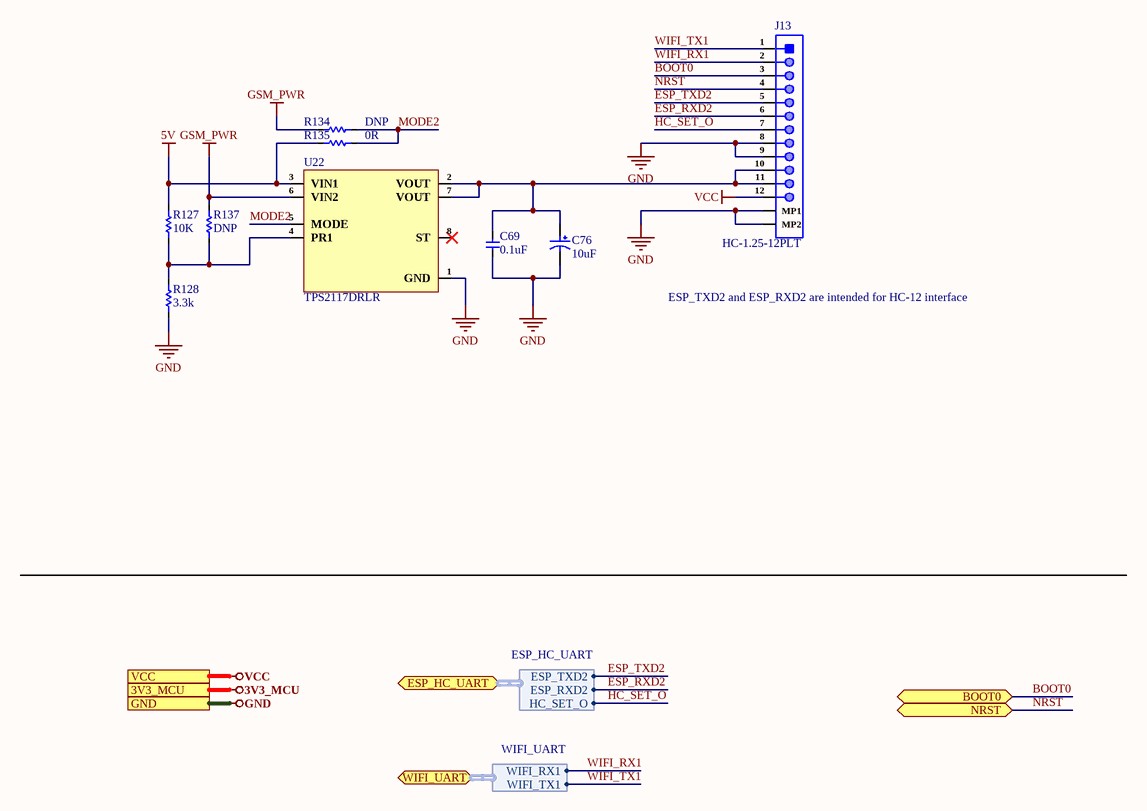
[diagram p11: WIFI_Display_Sheet.SchDoc]

### Parts
C69  0.1uF  [Cap-0603]
C76  10uF  [RVT1E100M0405_]
J13  HC-1.25-12PLT  [HC-1.25-12PLT]
R127  10K  [Res-0603]
R128  3.3k  [Res-0603]
R134  DNP  [Res-0603]
R135  0R  [Res-0603]
R137  DNP  [Res-0603]
U22  TPS2117DRLR  [SOT-583]

### Ports
3V3_MCU, BOOT0 (bidir), ESP_HC_UART (bidir, harness ESP_HC_UART), GND, NRST (bidir), VCC, WIFI_UART (bidir, harness WIFI_UART)

### Harnesses
WIFI_UART: WIFI_RX1, WIFI_TX1
ESP_HC_UART: ESP_TXD2, ESP_RXD2, HC_SET_O

### Nets
5V: R127.2 R135.1 U22.3(VIN1)
GND: C69.1 C76.2 J13.8 J13.9 J13.MP1 J13.MP2 R128.1 U22.1(GND) ; port GND
GSM_PWR: R134.1 R137.2 U22.6(VIN2)
VCC: J13.12 ; port VCC
BOOT0: J13.3 ; port BOOT0
ESP_RXD2: J13.6 ; port ESP_HC_UART.ESP_RXD2
ESP_TXD2: J13.5 ; port ESP_HC_UART.ESP_TXD2
HC_SET_O: J13.7 ; port ESP_HC_UART.HC_SET_O
MODE2: R134.2 R135.2 U22.5(MODE)
NRST: J13.4 ; port NRST
WIFI_RX1: J13.2 ; port WIFI_UART.WIFI_RX1
WIFI_TX1: J13.1 ; port WIFI_UART.WIFI_TX1
NetC69_2: C69.2 C76.1 J13.10 J13.11 U22.2(VOUT) U22.7(VOUT)
NetR127_1: R127.1 R128.2 R137.1 U22.4(PR1)

Not connected (* = marked no-connect by the designer): U22 8(ST)*

### Notes on the sheet
- ESP_TXD2 and ESP_RXD2 are intended for HC-12 interface
- File:
- Title:
- Date:
- Page
- Num:
- Total:
- Drawn By: Huzaifa Ali

### Library data of the parts
C69 = CC0603ZRY5V9BB104: CAP CER 0.1UF 50V Y5V 0603; Manufacturer: Yageo; Capacitance: 100nF; Tolerance: 80%; Item Type: Capacitor; Supplier 1: Digi-Key; Manufacturer Part Number: CC0603ZRY5V9BB104; Stock 1: 15000880; Pricing 1: 1=0.1, 10=0.075, 100=0.0334, 500=0.02386, 1000=0.01874 (USD); Mount: Surface Mount; Case/Package: 0603; Number of Pins: 2; Case Code (Metric): 1608; Case Code (Imperial): 0603; Min Operating Temperature: -30°C; Max Operating Temperature: 85°C; Dielectric: Y5V; Voltage Rating: 50V; Package Quantity: 1; Packaging: Tape and Reel; Voltage Rating (DC): 50V; Termination: SMD/SMT; Composition: Ceramic; Voltage: 50V; Length: 1.6mm; Height: 0.8mm; Width: 0.031inch; Thickness: 0.035inch; Depth: 0.8mm; Radiation Hardening: No; REACH SVHC: No SVHC; Lead Free: Lead Free; Halogen Free: Halogen Free; ComponentLink1URL: http://www.yageo.com/documents/recent/UPY-GPHC_Y5V_6.3V-to-50V_8.pdf?src-supplier=Digi-Key; ComponentLink1Description: http://www.yageo.com/documents/recent/UPY-GPHC_Y5V_6.3V-to-50V_8.pdf?src-supplier=Digi-Key; ComponentLink2URL: http://www.yageo.com/documents/recent/UPY-GPHC_Y5V_6.3V-to-50V_5.pdf?src-supplier=Avnet+Europe; ComponentLink2Description: http://www.yageo.com/documents/recent/UPY-GPHC_Y5V_6.3V-to-50V_5.pdf?src-supplier=Avnet+Europe; ComponentLink3URL: https://www.verical.com/server-webapp/html/getDatasheet?partID=403611&src-supplier=Verical; ComponentLink3Description: https://www.verical.com/server-webapp/html/getDatasheet?partID=403611&src-supplier=Verical; ComponentLink4URL: http://www.mouser.com/ds/2/447/Yageo_UPY-GP_NP0_16V-to-50V_9-358835.pdf?src-supplier=Mouser; ComponentLink4Description: http://www.mouser.com/ds/2/447/Yageo_UPY-GP_NP0_16V-to-50V_9-358835.pdf?src-supplier=Mouser; ComponentLink5URL: http://www.farnell.com/datasheets/1132289.pdf?src-supplier=Element14; ComponentLink5Description: http://www.farnell.com/datasheets/1132289.pdf?src-supplier=Element14; Supplier Part Number 1: 311-1343-1-ND; LCSC Part Number: C106221
C76 = RVT1E100M0405: CAP ALUM 10uF 25V SMD; Manufacturer: ROQANG; φD: 4mm; L: 5.4mm; Tolerance: ±20%; Item Type: Capacitor; Operating Temperature: -45℃~+105℃; Rated Voltage: 25V; Capacitance: 10uF; Manufacturer Part Number: RVT1E100M0405; ComponentLink1Description: LCSC; ComponentLink1URL: https://www.lcsc.com/product-detail/Aluminum-Electrolytic-Capacitors-SMD_10uF-25V-20_C72484.html; LCSC Part Number: C970655
J13 = HC-1.25-12PLT: 1x12P 12P PicoBlade(MX 1.25) Tin 12 -25℃~+85℃ 2A 1 1.25mm Brass Surface Mount,Vertical SMD,P=1.25mm Wire To Board Connector ROHS; Manufacturer: HCTL; Manufacturer Part Number: HC-1.25-12PLT; Package: SMD,P=1.25mm; LCSC Part Number: C2937190; Item Type: Wire To Board Connector; ComponentLink1Description: LCSC; ComponentLink1URL: https://lcsc.com/product-detail/Wire-To-Board-Connector_HCTL-HC-1-25-12PLT_C2937190.html?s_z=n_1.25-12plt
R127 R137 = RT0603BRD0710KL: RES SMD 10K OHM 0.1% 1/10W 0603; Manufacturer: Yageo; Power: 100mW; Rated Temperature: 70°C; Value: 10kR; Temperature Coefficient: 25ppm/°C; Working Voltage: 75V; Package Height: 0.45mm; Package Length: 1.6mm; Package Width: 0.8mm; Item Type: Resistor; Supplier 1: Rs; Manufacturer Part Number: RT0603BRD0710KL; RoHS: Yes; Category: Chip SMD Resistors; Stock 1: 20510; Pricing 1: 100=0.29800, 250=0.27800, 500=0.25900, 1000=0.23700 (GBP); Mounting Technology: Surface Mount; Pins: 2; Case/Package: 0603; Min Operating Temperature: -55°C; Max Operating Temperature: 155°C; Tolerance: 0.1%; Resistor Type: FIXED RESISTOR; Construction: Chip; Package Style: SMTMeter; Packaging: Tape and Reel; Technology: THIN FILM; Termination: Wraparound; Reach SVHC Compliant: Yes; RoHS Compliant: Yes; ComponentLink1URL: https://datasheet.ciiva.com:443/pdfs/VipMasterIC/IC/YAGO/YAGO-S-A0008510989/YAGO-S-A0008510989-1.pdf?src-supplier=IHS+Markit; ComponentLink1Description: https://datasheet.ciiva.com:443/pdfs/VipMasterIC/IC/YAGO/YAGO-S-A0008510989/YAGO-S-A0008510989-1.pdf?src-supplier=IHS+Markit; ComponentLink2URL: https://datasheet.ciiva.com/5624/pyu-rt-1-to-0-05-rohs-l-4-5624351.pdf?src-supplier=Mouser; ComponentLink2Description: https://datasheet.ciiva.com/5624/pyu-rt-1-to-0-05-rohs-l-4-5624351.pdf?src-supplier=Mouser; ComponentLink3URL: https://datasheet.ciiva.com/29721/pyu-rt-1-to-0-05-rohs-l-4-29721177.pdf?src-supplier=Digi-Key; ComponentLink3Description: https://datasheet.ciiva.com/29721/pyu-rt-1-to-0-05-rohs-l-4-29721177.pdf?src-supplier=Digi-Key; Supplier Part Number 1: 1991391P; LCSC Part Number: C95204
R128 = RT0603BRD073K3L: RES SMD 3.3K OHM 0.1% 1/10W 0603; Manufacturer: Yageo; Resistance: 3.3kR; Power Rating: 100mW; Voltage Rating: 75V; Temperature Coefficient: 25ppm/°C; Voltage Rating (DC): 50V; Item Type: Resistor; Supplier 1: Arrow Electronics; Manufacturer Part Number: RT0603BRD073K3L; RoHS: Yes; Category: Chip SMD Resistors; Stock 1: 2417; Pricing 1: 1=0.30610, 10=0.21080, 25=0.17430, 100=0.09180, 250=0.09000, 500=0.07600, 1000=0.04220 (USD); Case/Package: 0603; Case Code (Metric): 1608; Case Code (Imperial): 0603; Contact Plating: Tin,Lead; Min Operating Temperature: -55°C; Max Operating Temperature: 125°C; Package Quantity: 5000; Packaging: Tape and Reel; Tolerance: 0.1%; Resistor Type: Thin Film; Number of Terminations: 2; Termination: SMD/SMT; Max Power Dissipation: 100mW; Features: Moisture Resistant; Series: RT; Construction: Rectangular; Length: 0.063inch; Width: 0.031inch; Height: 0.022inch; Depth: 0.8mm; Military Standard: Not; Lead Free: Lead Free; RoHS Compliant: Yes; ComponentLink1URL: https://datasheet.ciiva.com/11814/0900766b8027bd26-11814026.pdf?src-supplier=Rs; ComponentLink1Description: https://datasheet.ciiva.com/11814/0900766b8027bd26-11814026.pdf?src-supplier=Rs; ComponentLink2URL: https://datasheet.ciiva.com/12694/pyu-rt-1-to-0-05-rohs-l-4-12694839.pdf?src-supplier=Mouser; ComponentLink2Description: https://datasheet.ciiva.com/12694/pyu-rt-1-to-0-05-rohs-l-4-12694839.pdf?src-supplier=Mouser; ComponentLink3URL: https://datasheet.ciiva.com/2585/pyu-rt-1-to-0-05-rohs-l-4-2585926.pdf?src-supplier=Digi-Key; ComponentLink3Description: https://datasheet.ciiva.com/2585/pyu-rt-1-to-0-05-rohs-l-4-2585926.pdf?src-supplier=Digi-Key; Supplier Part Number 1: RT0603BRD073K3L; LCSC Part Number: C309653
R134 R135 = RC0603JR-070RL: RES 0 OHM JUMPER 1/10W 0603; Manufacturer: Yageo; Resistance: 0mR; Tolerance: 1%; Power Rating: 100mW; Voltage Rating (DC): 50V; Temperature Coefficient: 200ppm/°C; Resistance Tolerance: 5%; Item Type: Resistor; Supplier 1: Digi-Key; Manufacturer Part Number: RC0603JR-070RL; RoHS: Yes; Category: Chip SMD Resistors; Stock 1: 18081776; Pricing 1: 1=0.10000, 10=0.01700, 25=0.01240, 50=0.00960, 100=0.00700, 250=0.00536, 500=0.00430, 1000=0.00316 (USD); Case/Package: 0603; Number of Pins: 2; Contact Plating: Tin,Matte; Case Code (Imperial): 0603; Case Code (Metric): 1608; Size Code: 0603; Min Operating Temperature: -55°C; Max Operating Temperature: 155°C; Resistor Type: Thick Film; Packaging: Tape and Reel; Termination: SMD/SMT; Series: RC; Technology: THICK FILM; Package Quantity: 5000; Voltage Rating: 50V; Features: Moisture Resistant; Max Power Dissipation: 100mW; Number of Terminations: 2; Construction: Rectangular; Length: 1.6mm; Width: 0.8mm; Height: 0.45mm; Depth: 0.8mm; Radiation Hardening: No; Reach SVHC Compliant: No SVHC; Lead Free: Lead Free; RoHS Compliant: Yes; Military Standard: Not; Supplier Part Number 1: 311-0.0GRCT-ND; LCSC Part Number: C95177
U22 = TPS2117DRLR: 1.6-V TO 5.5-V, 20-M, 4-A LOW IQ; Manufacturer: Texas Instruments; Item Type: IC; Supplier: Mouser; Supplier Part Number: 595-TPS2117DRLR; Manufacturer Part Number: TPS2117DRLR; RoHS: No; Stock: 3415; Pricing: 1=1.34, 10=1.2, 50=1.2, 100=0.938, 1000=0.612, 10000=0.522 (USD); Pins: 8; Length: 2.1mm; Width: 1.2mm; Height: 600um; Thickness: 550um